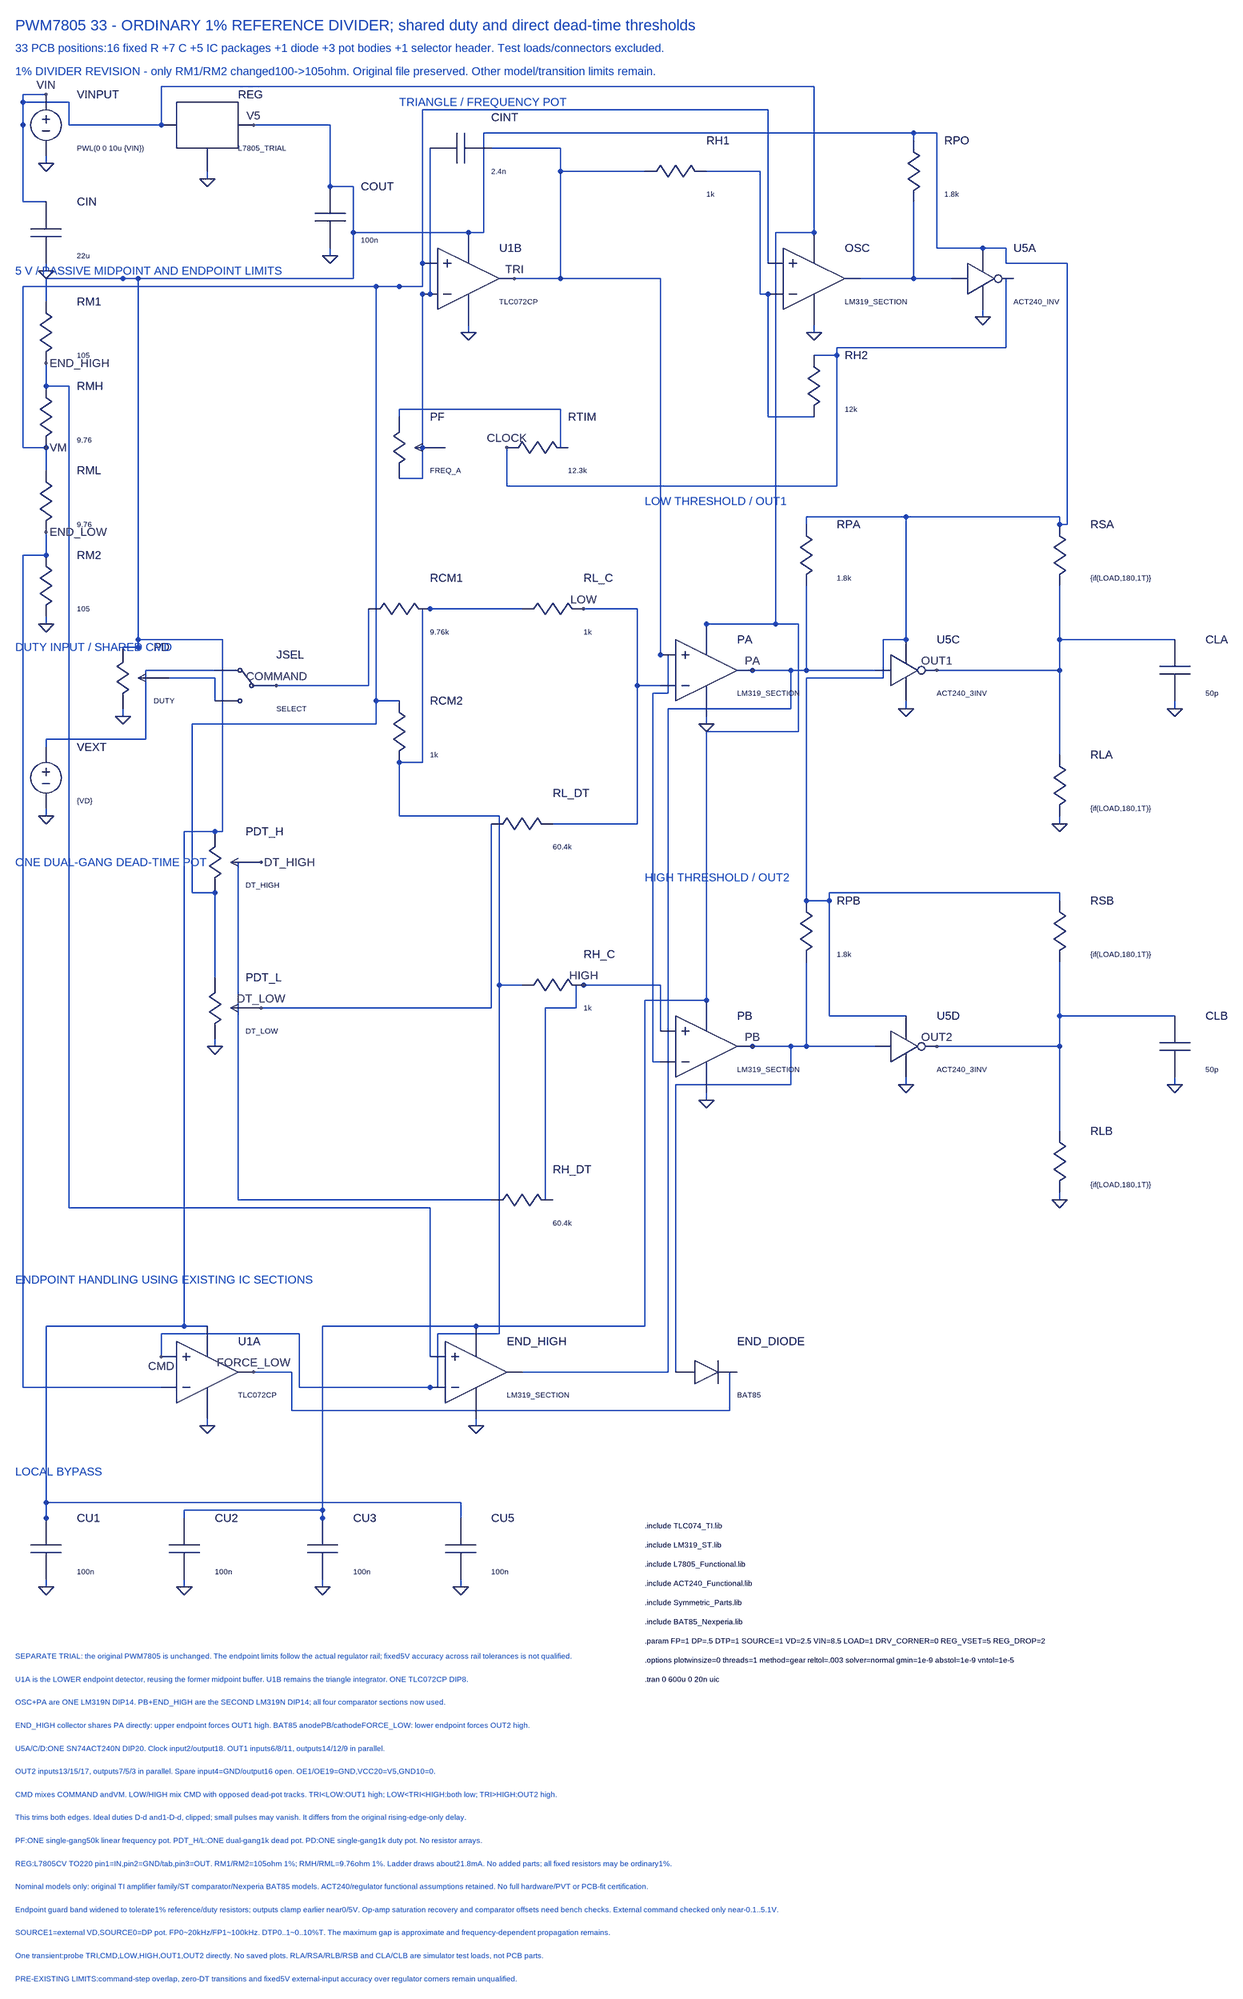
[diagram p0: schematic analog_pwm_dead_time.asc]
analog_pwm_dead_time.asc, the LTspice schematic file:
Version 4
SHEET 1 2816 4544
WIRE 512 1392 512 1440
WIRE 416 1392 512 1392
WIRE 832 1248 832 1408
WIRE 640 1408 832 1408
WIRE 896 832 896 848
WIRE 896 832 1232 832
WIRE 1232 832 1232 912
WIRE 1232 912 1248 912
WIRE 1856 560 1968 560
WIRE 1968 560 2048 560
WIRE 1968 400 1968 560
WIRE 368 1376 512 1376
WIRE 368 1376 368 1520
WIRE 160 1520 368 1520
WIRE 160 1520 160 1536
WIRE 1440 2032 1440 2128
WIRE 1280 2032 1440 2032
WIRE 1200 2480 1216 2480
WIRE 1200 2080 1200 2480
WIRE 1200 2080 1264 2080
WIRE 1264 2032 1264 2080
WIRE 1264 2032 1280 2032
WIRE 1392 1408 1440 1408
WIRE 1392 1248 1392 1408
WIRE 1280 1248 1392 1248
WIRE 1216 1696 1392 1696
WIRE 1392 1408 1392 1696
WIRE 1088 1696 1088 2080
WIRE 608 2080 1088 2080
WIRE 1584 3152 1600 3152
WIRE 1584 3152 1584 3232
WIRE 672 3232 1584 3232
WIRE 672 3152 672 3232
WIRE 592 3152 672 3152
WIRE 960 288 960 592
WIRE 944 592 960 592
WIRE 944 912 992 912
WIRE 944 592 944 912
WIRE 944 592 960 592
WIRE 896 976 944 976
WIRE 944 912 944 976
WIRE 1648 592 1664 592
WIRE 1648 336 1648 592
WIRE 1536 336 1648 336
WIRE 1664 848 1760 848
WIRE 1664 592 1664 848
WIRE 560 2480 1088 2480
WIRE 560 1776 560 2480
WIRE 560 1776 608 1776
WIRE 2272 1376 2272 1552
WIRE 2016 1376 2272 1376
WIRE 2272 1200 2272 1312
WIRE 2272 1312 2272 1376
WIRE 2272 1312 2512 1312
WIRE 2272 2160 2272 2336
WIRE 2016 2160 2272 2160
WIRE 2272 1984 2272 2096
WIRE 2272 2096 2272 2160
WIRE 2272 2096 2512 2096
WIRE 1632 2160 1712 2160
WIRE 1712 2160 1744 2160
WIRE 1744 2160 1888 2160
WIRE 1744 1984 1744 2160
WIRE 1472 2240 1472 3152
WIRE 1472 2240 1712 2240
WIRE 1712 2160 1712 2240
WIRE 1632 2160 1712 2160
WIRE 1760 720 1808 720
WIRE 1808 720 1808 992
WIRE 1120 992 1808 992
WIRE 1120 912 1120 992
WIRE 2160 560 2176 560
WIRE 2160 560 2160 704
WIRE 1808 704 2160 704
WIRE 1808 704 1808 720
WIRE 160 1088 160 1136
WIRE 112 3184 400 3184
WIRE 112 1136 112 3184
WIRE 112 1136 160 1136
WIRE 1632 1376 1712 1376
WIRE 1712 1376 1744 1376
WIRE 1744 1376 1888 1376
WIRE 1744 1200 1744 1376
WIRE 1152 3152 1456 3152
WIRE 1456 1456 1456 3152
WIRE 1456 1456 1712 1456
WIRE 1712 1376 1712 1456
WIRE 1632 1376 1712 1376
WIRE 160 736 160 784
WIRE 960 2496 960 3120
WIRE 208 2496 960 2496
WIRE 208 784 208 2496
WIRE 160 784 208 784
WIRE 1088 288 1232 288
WIRE 1232 288 1232 336
WIRE 1232 336 1232 560
WIRE 1136 560 1232 560
WIRE 1232 336 1408 336
WIRE 1440 560 1440 1344
WIRE 1232 560 1440 560
WIRE 1424 2192 1440 2192
WIRE 1424 1424 1424 2192
WIRE 1424 1424 1456 1424
WIRE 1456 1344 1456 1424
WIRE 1440 1344 1456 1344
WIRE 160 912 160 960
WIRE 944 528 944 576
WIRE 112 576 848 576
WIRE 848 576 896 576
WIRE 896 576 944 576
WIRE 112 576 112 912
WIRE 112 912 160 912
WIRE 1664 208 1664 528
WIRE 944 208 1664 208
WIRE 944 208 944 528
WIRE 848 1440 896 1440
WIRE 848 576 848 1440
WIRE 848 576 896 576
WIRE 464 1840 512 1840
WIRE 464 1488 464 1840
WIRE 464 1488 848 1488
WIRE 848 1440 848 1488
WIRE 512 1840 512 2016
WIRE 688 3184 960 3184
WIRE 688 3072 688 3184
WIRE 400 3072 688 3072
WIRE 400 3072 400 3120
WIRE 1104 2032 1152 2032
WIRE 1104 2032 1104 3072
WIRE 976 3072 1104 3072
WIRE 976 3072 976 3184
WIRE 960 3184 976 3184
WIRE 896 1568 896 1680
WIRE 896 1680 1104 1680
WIRE 1104 1680 1104 2032
WIRE 944 1248 960 1248
WIRE 944 1248 944 1568
WIRE 896 1568 944 1568
WIRE 960 1248 1152 1248
WIRE 112 400 160 400
WIRE 112 176 112 192
WIRE 112 192 112 240
WIRE 112 240 112 400
WIRE 112 176 160 176
WIRE 208 240 400 240
WIRE 208 192 208 240
WIRE 112 192 208 192
WIRE 112 192 112 240
WIRE 1760 160 1760 464
WIRE 400 160 1760 160
WIRE 400 160 400 240
WIRE 1536 1280 1680 1280
WIRE 1680 464 1680 1280
WIRE 1680 464 1760 464
WIRE 1536 1504 1536 2064
WIRE 1536 1504 1728 1504
WIRE 1728 1280 1728 1504
WIRE 1536 1280 1680 1280
WIRE 1680 1280 1728 1280
WIRE 1056 3056 1408 3056
WIRE 1408 2064 1408 3056
WIRE 1408 2064 1536 2064
WIRE 736 3056 736 3440
WIRE 736 3440 736 3456
WIRE 736 3056 1056 3056
WIRE 448 3440 448 3456
WIRE 448 3440 736 3440
WIRE 736 3440 736 3456
WIRE 752 240 752 368
WIRE 592 240 752 240
WIRE 800 464 1040 464
WIRE 800 368 800 464
WIRE 752 368 800 368
WIRE 160 560 160 608
WIRE 160 560 320 560
WIRE 320 560 352 560
WIRE 352 560 800 560
WIRE 800 464 800 560
WIRE 320 1328 352 1328
WIRE 352 560 352 1312
WIRE 352 1312 352 1328
WIRE 320 560 352 560
WIRE 512 1712 528 1712
WIRE 528 1312 528 1712
WIRE 352 1312 528 1312
WIRE 352 1312 352 1328
WIRE 2016 496 2112 496
WIRE 2016 256 2016 496
WIRE 1072 256 1968 256
WIRE 1968 256 2016 256
WIRE 1072 256 1072 464
WIRE 1040 464 1072 464
WIRE 1968 256 1968 272
WIRE 2272 1072 2288 1072
WIRE 2288 528 2288 1072
WIRE 2160 528 2288 528
WIRE 2160 496 2160 528
WIRE 2112 496 2160 496
WIRE 1744 1056 1744 1072
WIRE 1744 1056 1952 1056
WIRE 1952 1056 2272 1056
WIRE 2272 1056 2272 1072
WIRE 1952 1056 1952 1312
WIRE 1744 1392 1744 1856
WIRE 1744 1392 1904 1392
WIRE 1904 1312 1904 1392
WIRE 1904 1312 1952 1312
WIRE 1792 2096 1952 2096
WIRE 1792 1856 1792 2096
WIRE 1744 1856 1792 1856
WIRE 2272 1840 2272 1856
WIRE 1792 1840 2272 1840
WIRE 1792 1840 1792 1856
WIRE 448 3056 496 3056
WIRE 448 1712 448 3056
WIRE 448 1712 512 1712
WIRE 160 3056 160 3424
WIRE 160 3424 160 3456
WIRE 160 3056 448 3056
WIRE 1024 3424 1024 3456
WIRE 160 3424 1024 3424
WIRE 160 3424 160 3456
WIRE 160 304 160 320
FLAG 160 320 0
WIRE 496 336 496 352
FLAG 496 352 0
WIRE 160 528 160 544
FLAG 160 544 0
WIRE 752 496 752 512
FLAG 752 512 0
WIRE 160 1264 160 1280
FLAG 160 1280 0
WIRE 496 3248 496 3264
FLAG 496 3264 0
WIRE 1040 656 1040 672
FLAG 1040 672 0
WIRE 1760 656 1760 672
FLAG 1760 672 0
WIRE 2112 624 2112 640
FLAG 2112 640 0
WIRE 160 1664 160 1680
FLAG 160 1680 0
WIRE 320 1456 320 1472
FLAG 320 1472 0
WIRE 512 2144 512 2160
FLAG 512 2160 0
WIRE 1536 1472 1536 1488
FLAG 1536 1488 0
WIRE 1536 2256 1536 2272
FLAG 1536 2272 0
WIRE 1056 3248 1056 3264
FLAG 1056 3264 0
WIRE 1952 1440 1952 1456
FLAG 1952 1456 0
WIRE 1952 2224 1952 2240
FLAG 1952 2240 0
WIRE 160 3584 160 3600
FLAG 160 3600 0
WIRE 448 3584 448 3600
FLAG 448 3600 0
WIRE 736 3584 736 3600
FLAG 736 3600 0
WIRE 1024 3584 1024 3600
FLAG 1024 3600 0
WIRE 2272 1680 2272 1696
FLAG 2272 1696 0
WIRE 2272 2464 2272 2480
FLAG 2272 2480 0
WIRE 2512 1440 2512 1456
FLAG 2512 1456 0
WIRE 2512 2224 2512 2240
FLAG 2512 2240 0
SYMBOL PWM_V 160 240 R0
SYMATTR InstName VINPUT
SYMATTR Value PWL(0 0 10u {VIN})
SYMBOL PWM_REG 496 240 R0
SYMATTR InstName REG
SYMATTR Value L7805_TRIAL
SYMBOL PWM_CV 160 464 R0
SYMATTR InstName CIN
SYMATTR Value 22u
SYMATTR SpiceLine Rser=.3
SYMBOL PWM_CV 752 432 R0
SYMATTR InstName COUT
SYMATTR Value 100n
SYMBOL PWM_RV 160 672 R0
SYMATTR InstName RM1
SYMATTR Value 105
SYMBOL PWM_RV 160 848 R0
SYMATTR InstName RMH
SYMATTR Value 9.76
SYMBOL PWM_RV 160 1024 R0
SYMATTR InstName RML
SYMATTR Value 9.76
SYMBOL PWM_RV 160 1200 R0
SYMATTR InstName RM2
SYMATTR Value 105
SYMBOL PWM_AMP 496 3152 R0
SYMATTR InstName U1A
SYMATTR Value TLC072CP
SYMBOL PWM_AMP 1040 560 R0
SYMATTR InstName U1B
SYMATTR Value TLC072CP
SYMBOL PWM_RH 1184 912 R0
SYMATTR InstName RTIM
SYMATTR Value 12.3k
SYMBOL PWM_POT 896 912 R0
SYMATTR InstName PF
SYMATTR Value FREQ_A
SYMBOL PWM_CH 1024 288 R0
SYMATTR InstName CINT
SYMATTR Value 2.4n
SYMBOL PWM_RH 1472 336 R0
SYMATTR InstName RH1
SYMATTR Value 1k
SYMBOL PWM_RV 1760 784 R0
SYMATTR InstName RH2
SYMATTR Value 12k
SYMBOL PWM_CMP 1760 560 R0
SYMATTR InstName OSC
SYMATTR Value LM319_SECTION
SYMBOL PWM_RV 1968 336 R0
SYMATTR InstName RPO
SYMATTR Value 1.8k
SYMBOL PWM_INV 2112 560 R0
SYMATTR InstName U5A
SYMATTR Value ACT240_INV
SYMBOL PWM_V 160 1600 R0
SYMATTR InstName VEXT
SYMATTR Value {VD}
SYMBOL PWM_POT 320 1392 R0
SYMATTR InstName PD
SYMATTR Value DUTY
SYMBOL PWM_JUMP 576 1408 R0
SYMATTR InstName JSEL
SYMATTR Value SELECT
SYMBOL PWM_POT 512 1776 R0
SYMATTR InstName PDT_H
SYMATTR Value DT_HIGH
SYMBOL PWM_POT 512 2080 R0
SYMATTR InstName PDT_L
SYMATTR Value DT_LOW
SYMBOL PWM_RH 896 1248 R0
SYMATTR InstName RCM1
SYMATTR Value 9.76k
SYMBOL PWM_RV 896 1504 R0
SYMATTR InstName RCM2
SYMATTR Value 1k
SYMBOL PWM_RH 1216 1248 R0
SYMATTR InstName RL_C
SYMATTR Value 1k
SYMBOL PWM_RH 1152 1696 R0
SYMATTR InstName RL_DT
SYMATTR Value 60.4k
SYMBOL PWM_RH 1216 2032 R0
SYMATTR InstName RH_C
SYMATTR Value 1k
SYMBOL PWM_RH 1152 2480 R0
SYMATTR InstName RH_DT
SYMATTR Value 60.4k
SYMBOL PWM_CMP 1536 1376 R0
SYMATTR InstName PA
SYMATTR Value LM319_SECTION
SYMBOL PWM_CMP 1536 2160 R0
SYMATTR InstName PB
SYMATTR Value LM319_SECTION
SYMBOL PWM_CMP 1056 3152 R0
SYMATTR InstName END_HIGH
SYMATTR Value LM319_SECTION
SYMBOL PWM_DX 1536 3152 R0
SYMATTR InstName END_DIODE
SYMATTR Value BAT85
SYMBOL PWM_RV 1744 1136 R0
SYMATTR InstName RPA
SYMATTR Value 1.8k
SYMBOL PWM_RV 1744 1920 R0
SYMATTR InstName RPB
SYMATTR Value 1.8k
SYMBOL PWM_INV 1952 1376 R0
SYMATTR InstName U5C
SYMATTR Value ACT240_3INV
SYMBOL PWM_INV 1952 2160 R0
SYMATTR InstName U5D
SYMATTR Value ACT240_3INV
SYMBOL PWM_CV 160 3520 R0
SYMATTR InstName CU1
SYMATTR Value 100n
SYMBOL PWM_CV 448 3520 R0
SYMATTR InstName CU2
SYMATTR Value 100n
SYMBOL PWM_CV 736 3520 R0
SYMATTR InstName CU3
SYMATTR Value 100n
SYMBOL PWM_CV 1024 3520 R0
SYMATTR InstName CU5
SYMATTR Value 100n
SYMBOL PWM_RV 2272 1616 R0
SYMATTR InstName RLA
SYMATTR Value {if(LOAD,180,1T)}
SYMBOL PWM_RV 2272 1136 R0
SYMATTR InstName RSA
SYMATTR Value {if(LOAD,180,1T)}
SYMBOL PWM_RV 2272 2400 R0
SYMATTR InstName RLB
SYMATTR Value {if(LOAD,180,1T)}
SYMBOL PWM_RV 2272 1920 R0
SYMATTR InstName RSB
SYMATTR Value {if(LOAD,180,1T)}
SYMBOL PWM_CV 2512 1376 R0
SYMATTR InstName CLA
SYMATTR Value 50p
SYMBOL PWM_CV 2512 2160 R0
SYMATTR InstName CLB
SYMATTR Value 50p
FLAG 160 176 VIN
FLAG 592 240 V5
FLAG 160 912 VM
FLAG 1136 560 TRI
FLAG 1120 912 CLOCK
FLAG 640 1408 COMMAND
FLAG 1280 1248 LOW
FLAG 1280 2032 HIGH
FLAG 608 1776 DT_HIGH
FLAG 608 2080 DT_LOW
FLAG 400 3120 CMD
FLAG 160 736 END_HIGH
FLAG 160 1088 END_LOW
FLAG 592 3152 FORCE_LOW
FLAG 1632 1376 PA
FLAG 1632 2160 PB
FLAG 2016 1376 OUT1
FLAG 2016 2160 OUT2
TEXT 96 32 Left 3 ;PWM7805 33 - ORDINARY 1% REFERENCE DIVIDER; shared duty and direct dead-time thresholds
TEXT 96 80 Left 2 ;33 PCB positions:16 fixed R +7 C +5 IC packages +1 diode +3 pot bodies +1 selector header. Test loads/connectors excluded.
TEXT 96 544 Left 2 ;5 V / PASSIVE MIDPOINT AND ENDPOINT LIMITS
TEXT 896 192 Left 2 ;TRIANGLE / FREQUENCY POT
TEXT 96 1328 Left 2 ;DUTY INPUT / SHARED CMD
TEXT 96 1776 Left 2 ;ONE DUAL-GANG DEAD-TIME POT
TEXT 1408 1024 Left 2 ;LOW THRESHOLD / OUT1
TEXT 1408 1808 Left 2 ;HIGH THRESHOLD / OUT2
TEXT 96 2960 Left 2 ;ENDPOINT HANDLING USING EXISTING IC SECTIONS
TEXT 96 3360 Left 2 ;LOCAL BYPASS
TEXT 96 3744 Left 1 ;SEPARATE TRIAL: the original PWM7805 is unchanged. The endpoint limits follow the actual regulator rail; fixed5V accuracy across rail tolerances is not qualified.
TEXT 96 3792 Left 1 ;U1A is the LOWER endpoint detector, reusing the former midpoint buffer. U1B remains the triangle integrator. ONE TLC072CP DIP8.
TEXT 96 3840 Left 1 ;OSC+PA are ONE LM319N DIP14. PB+END_HIGH are the SECOND LM319N DIP14; all four comparator sections now used.
TEXT 96 3888 Left 1 ;END_HIGH collector shares PA directly: upper endpoint forces OUT1 high. BAT85 anodePB/cathodeFORCE_LOW: lower endpoint forces OUT2 high.
TEXT 96 3936 Left 1 ;U5A/C/D:ONE SN74ACT240N DIP20. Clock input2/output18. OUT1 inputs6/8/11, outputs14/12/9 in parallel.
TEXT 96 3984 Left 1 ;OUT2 inputs13/15/17, outputs7/5/3 in parallel. Spare input4=GND/output16 open. OE1/OE19=GND,VCC20=V5,GND10=0.
TEXT 96 4032 Left 1 ;CMD mixes COMMAND andVM. LOW/HIGH mix CMD with opposed dead-pot tracks. TRI<LOW:OUT1 high; LOW<TRI<HIGH:both low; TRI>HIGH:OUT2 high.
TEXT 96 4080 Left 1 ;This trims both edges. Ideal duties D-d and1-D-d, clipped; small pulses may vanish. It differs from the original rising-edge-only delay.
TEXT 96 4128 Left 1 ;PF:ONE single-gang50k linear frequency pot. PDT_H/L:ONE dual-gang1k dead pot. PD:ONE single-gang1k duty pot. No resistor arrays.
TEXT 96 4176 Left 1 ;REG:L7805CV TO220 pin1=IN,pin2=GND/tab,pin3=OUT. RM1/RM2=105ohm 1%; RMH/RML=9.76ohm 1%. Ladder draws about21.8mA. No added parts; all fixed resistors may be ordinary1%.
TEXT 96 4224 Left 1 ;Nominal models only: original TI amplifier family/ST comparator/Nexperia BAT85 models. ACT240/regulator functional assumptions retained. No full hardware/PVT or PCB-fit certification.
TEXT 96 4272 Left 1 ;Endpoint guard band widened to tolerate1% reference/duty resistors; outputs clamp earlier near0/5V. Op-amp saturation recovery and comparator offsets need bench checks. External command checked only near-0.1..5.1V.
TEXT 96 4320 Left 1 ;SOURCE1=external VD,SOURCE0=DP pot. FP0~20kHz/FP1~100kHz. DTP0..1~0..10%T. The maximum gap is approximate and frequency-dependent propagation remains.
TEXT 96 4368 Left 1 ;One transient:probe TRI,CMD,LOW,HIGH,OUT1,OUT2 directly. No saved plots. RLA/RSA/RLB/RSB and CLA/CLB are simulator test loads, not PCB parts.
TEXT 1408 3472 Left 1 !.include TLC074_TI.lib
TEXT 1408 3512 Left 1 !.include LM319_ST.lib
TEXT 1408 3552 Left 1 !.include L7805_Functional.lib
TEXT 1408 3592 Left 1 !.include ACT240_Functional.lib
TEXT 1408 3632 Left 1 !.include Symmetric_Parts.lib
TEXT 1408 3672 Left 1 !.include BAT85_Nexperia.lib
TEXT 1408 3712 Left 1 !.param FP=1 DP=.5 DTP=1 SOURCE=1 VD=2.5 VIN=8.5 LOAD=1 DRV_CORNER=0 REG_VSET=5 REG_DROP=2
TEXT 1408 3752 Left 1 !.options plotwinsize=0 threads=1 method=gear reltol=.003 solver=normal gmin=1e-9 abstol=1e-9 vntol=1e-5
TEXT 1408 3792 Left 1 !.tran 0 600u 0 20n uic
TEXT 96 128 Left 2 ;1% DIVIDER REVISION - only RM1/RM2 changed100->105ohm. Original file preserved. Other model/transition limits remain.
TEXT 96 4416 Left 1 ;PRE-EXISTING LIMITS:command-step overlap, zero-DT transitions and fixed5V external-input accuracy over regulator corners remain unqualified.

The netlist it stands for:
* analog_pwm_dead_time.asc
VINPUT VIN 0 PWL(0 0 10u {VIN})
XREG 0 V5 VIN L7805_TRIAL  ; pins P1 P2 P3
CIN VIN 0 22u Rser=.3
COUT V5 0 100n
RM1 V5 END_HIGH 105
RMH END_HIGH VM 9.76
RML VM END_LOW 9.76
RM2 END_LOW 0 105
XU1A CMD END_LOW V5 0 FORCE_LOW TLC072CP  ; pins P1 P2 P3 P4 P5
XU1B VM N005 V5 0 TRI TLC072CP  ; pins P1 P2 P3 P4 P5
RTIM CLOCK N002 12.3k
XPF N002 N005 N005 FREQ_A  ; pins P1 P2 P3
CINT N005 TRI 2.4n
RH1 TRI N006 1k
RH2 CLOCK N006 12k
XOSC VM N006 VIN 0 N003 LM319_SECTION  ; pins P1 P2 P3 P4 P5
RPO V5 N003 1.8k
XU5A CLOCK N003 V5 0 ACT240_INV  ; pins P1 P2 P3 P4
VEXT N004 0 {VD}
XPD V5 N001 0 DUTY  ; pins P1 P2 P3
XJSEL N004 N001 COMMAND SELECT  ; pins P1 P2 P3
XPDT_H V5 DT_HIGH VM DT_HIGH  ; pins P1 P2 P3
XPDT_L VM DT_LOW 0 DT_LOW  ; pins P1 P2 P3
RCM1 COMMAND CMD 9.76k
RCM2 VM CMD 1k
RL_C CMD LOW 1k
RL_DT DT_LOW LOW 60.4k
RH_C CMD HIGH 1k
RH_DT DT_HIGH HIGH 60.4k
XPA TRI LOW VIN 0 PA LM319_SECTION  ; pins P1 P2 P3 P4 P5
XPB HIGH TRI VIN 0 PB LM319_SECTION  ; pins P1 P2 P3 P4 P5
XEND_HIGH END_HIGH CMD VIN 0 PA LM319_SECTION  ; pins P1 P2 P3 P4 P5
XEND_DIODE PB FORCE_LOW BAT85  ; pins P1 P2
RPA V5 PA 1.8k
RPB V5 PB 1.8k
XU5C OUT1 PA V5 0 ACT240_3INV  ; pins P1 P2 P3 P4
XU5D OUT2 PB V5 0 ACT240_3INV  ; pins P1 P2 P3 P4
CU1 V5 0 100n
CU2 VIN 0 100n
CU3 VIN 0 100n
CU5 V5 0 100n
RLA OUT1 0 {if(LOAD,180,1T)}
RSA V5 OUT1 {if(LOAD,180,1T)}
RLB OUT2 0 {if(LOAD,180,1T)}
RSB V5 OUT2 {if(LOAD,180,1T)}
CLA OUT1 0 50p
CLB OUT2 0 50p
* PWM7805 33 - ORDINARY 1% REFERENCE DIVIDER; shared duty and direct dead-time thresholds
* 33 PCB positions:16 fixed R +7 C +5 IC packages +1 diode +3 pot bodies +1 selector header. Test loads/connectors excluded.
* 5 V / PASSIVE MIDPOINT AND ENDPOINT LIMITS
* TRIANGLE / FREQUENCY POT
* DUTY INPUT / SHARED CMD
* ONE DUAL-GANG DEAD-TIME POT
* LOW THRESHOLD / OUT1
* HIGH THRESHOLD / OUT2
* ENDPOINT HANDLING USING EXISTING IC SECTIONS
* LOCAL BYPASS
* SEPARATE TRIAL: the original PWM7805 is unchanged. The endpoint limits follow the actual regulator rail; fixed5V accuracy across rail tolerances is not qualified.
* U1A is the LOWER endpoint detector, reusing the former midpoint buffer. U1B remains the triangle integrator. ONE TLC072CP DIP8.
* OSC+PA are ONE LM319N DIP14. PB+END_HIGH are the SECOND LM319N DIP14; all four comparator sections now used.
* END_HIGH collector shares PA directly: upper endpoint forces OUT1 high. BAT85 anodePB/cathodeFORCE_LOW: lower endpoint forces OUT2 high.
* U5A/C/D:ONE SN74ACT240N DIP20. Clock input2/output18. OUT1 inputs6/8/11, outputs14/12/9 in parallel.
* OUT2 inputs13/15/17, outputs7/5/3 in parallel. Spare input4=GND/output16 open. OE1/OE19=GND,VCC20=V5,GND10=0.
* CMD mixes COMMAND andVM. LOW/HIGH mix CMD with opposed dead-pot tracks. TRI<LOW:OUT1 high; LOW<TRI<HIGH:both low; TRI>HIGH:OUT2 high.
* This trims both edges. Ideal duties D-d and1-D-d, clipped; small pulses may vanish. It differs from the original rising-edge-only delay.
* PF:ONE single-gang50k linear frequency pot. PDT_H/L:ONE dual-gang1k dead pot. PD:ONE single-gang1k duty pot. No resistor arrays.
* REG:L7805CV TO220 pin1=IN,pin2=GND/tab,pin3=OUT. RM1/RM2=105ohm 1%; RMH/RML=9.76ohm 1%. Ladder draws about21.8mA. No added parts; all fixed resistors may be ordinary1%.
* Nominal models only: original TI amplifier family/ST comparator/Nexperia BAT85 models. ACT240/regulator functional assumptions retained. No full hardware/PVT or PCB-fit certification.
* Endpoint guard band widened to tolerate1% reference/duty resistors; outputs clamp earlier near0/5V. Op-amp saturation recovery and comparator offsets need bench checks. External command checked only near-0.1..5.1V.
* SOURCE1=external VD,SOURCE0=DP pot. FP0~20kHz/FP1~100kHz. DTP0..1~0..10%T. The maximum gap is approximate and frequency-dependent propagation remains.
* One transient:probe TRI,CMD,LOW,HIGH,OUT1,OUT2 directly. No saved plots. RLA/RSA/RLB/RSB and CLA/CLB are simulator test loads, not PCB parts.
.include TLC074_TI.lib
.include LM319_ST.lib
.include L7805_Functional.lib
.include ACT240_Functional.lib
.include Symmetric_Parts.lib
.include BAT85_Nexperia.lib
.param FP=1 DP=.5 DTP=1 SOURCE=1 VD=2.5 VIN=8.5 LOAD=1 DRV_CORNER=0 REG_VSET=5 REG_DROP=2
.options plotwinsize=0 threads=1 method=gear reltol=.003 solver=normal gmin=1e-9 abstol=1e-9 vntol=1e-5
.tran 0 600u 0 20n uic
* 1% DIVIDER REVISION - only RM1/RM2 changed100->105ohm. Original file preserved. Other model/transition limits remain.
* PRE-EXISTING LIMITS:command-step overlap, zero-DT transitions and fixed5V external-input accuracy over regulator corners remain unqualified.
.backanno
.end